# Altium schematic sheet BMS-Controller-Sheet.SchDoc: Title
size 420 x 297 mm; Date: *******; ApprovedBy: *******; CheckedBy: None; Author: *******; CompanyName: *******; DrawnBy: Name; Engineer: *******; Organization: *******; Address1: *******; Address2: *******; Address3: *******; Address4: *******; DocumentNumber: Doc Num; Revision: *******; SheetNumber: 4; SheetTotal: 4; CurrentTime: *******; CurrentDate: *******; Time: *******; DocumentFullPathAndName: *******; DocumentName: *******; ModifiedDate: *******; ImagePath: *******; ProjectName: *******; Application_BuildNumber: *******
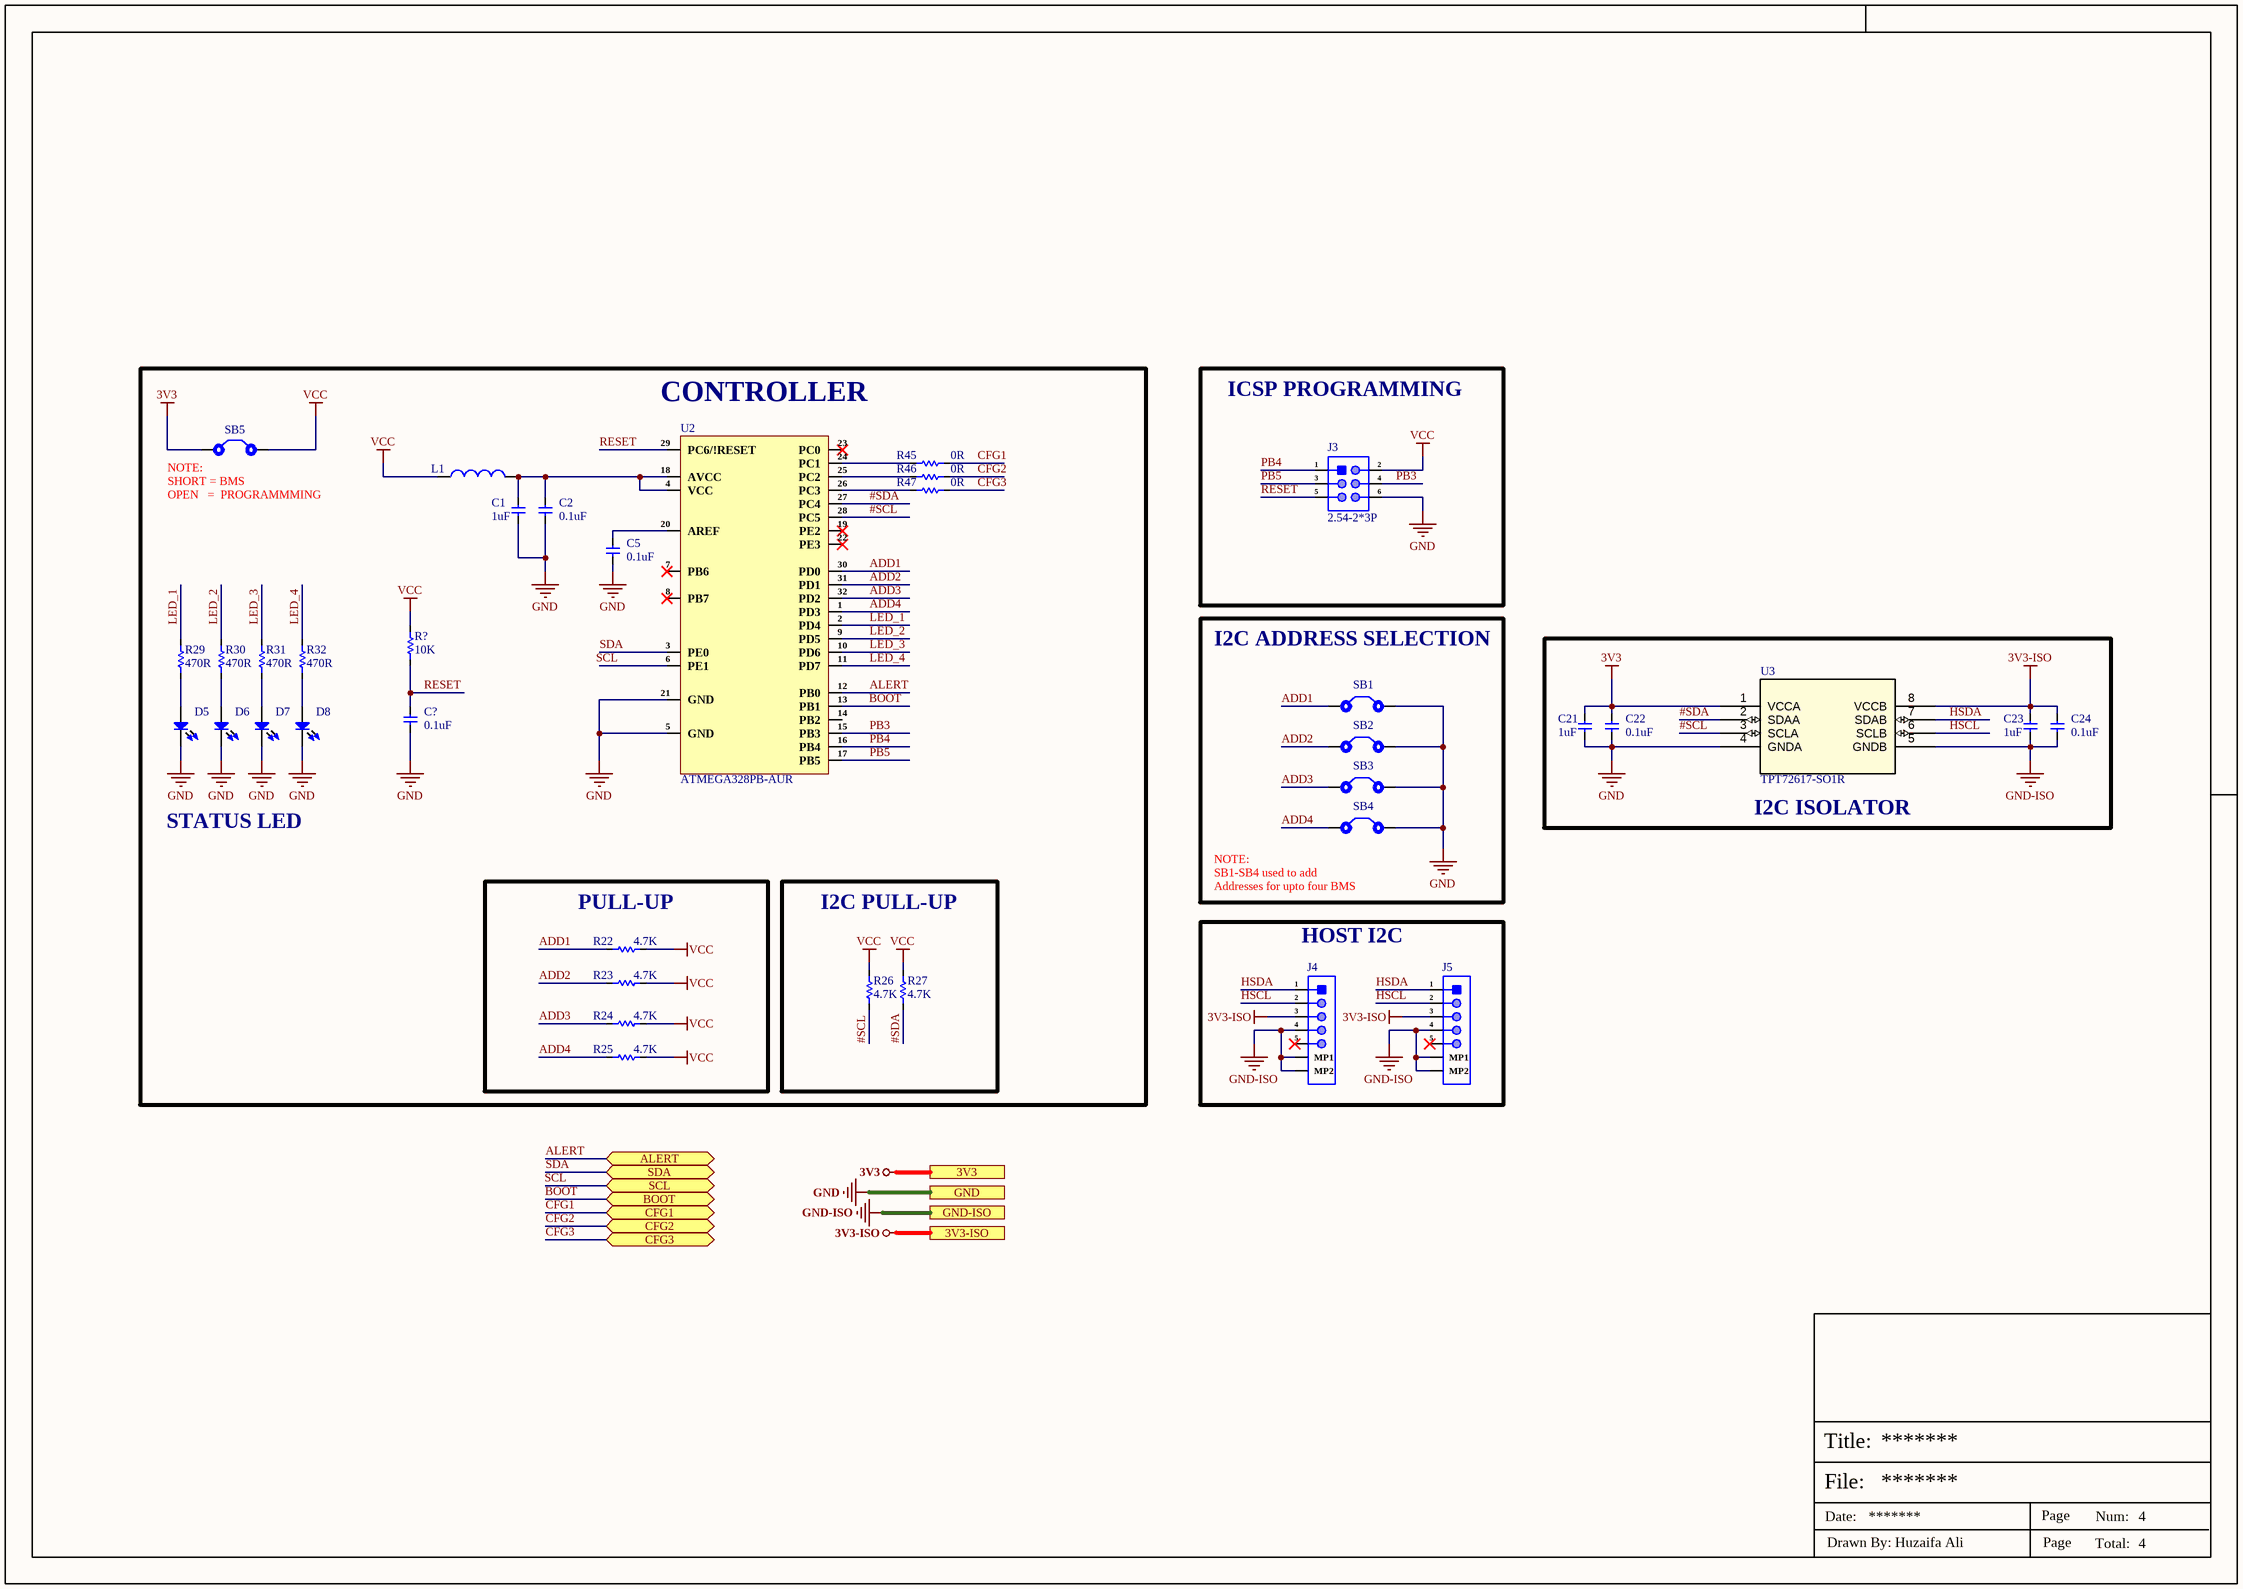
[diagram p0: BMS-Controller-Sheet.SchDoc]

## Parts
C1  1uF  [CAP-0201]
C2  0.1uF  [CAP-0201]
C5  0.1uF  [CAP-0201]
C21  1uF  [CAP-0201]
C22  0.1uF  [CAP-0201]
C23  1uF  [CAP-0201]
C24  0.1uF  [CAP-0201]
C?  0.1uF  [CAP-0201]
D5  QBLP617-IB  [LED-0603]  (value not drawn)
D6  QBLP617-IB  [LED-0603]  (value not drawn)
D7  QBLP617-IB  [LED-0603]  (value not drawn)
D8  QBLP617-IB  [LED-0603]  (value not drawn)
J3  2.54-2*3P  [2.54-2*3P]
J4  1.25-5PWB  [1.25-5PWB]  (value not drawn)
J5  1.25-5PWB  [1.25-5PWB]  (value not drawn)
L1  (no value)  [IND 0201]
R22  4.7K  [Res-0201]
R23  4.7K  [Res-0201]
R24  4.7K  [Res-0201]
R25  4.7K  [Res-0201]
R26  4.7K  [Res-0402]
R27  4.7K  [Res-0402]
R29  470R  [Res-0402]
R30  470R  [Res-0402]
R31  470R  [Res-0402]
R32  470R  [Res-0402]
R45  0R  [Res-0603]
R46  0R  [Res-0603]
R47  0R  [Res-0603]
R?  10K  [Res-0402]
SB1  Solder Bridge 0402  [Solder Bridge 0402]  (value not drawn)
SB2  Solder Bridge 0402  [Solder Bridge 0402]  (value not drawn)
SB3  Solder Bridge 0402  [Solder Bridge 0402]  (value not drawn)
SB4  Solder Bridge 0402  [Solder Bridge 0402]  (value not drawn)
SB5  Solder Bridge 0402  [Solder Bridge 0402]  (value not drawn)
U2  ATMEGA328PB-AUR  [32 TQFP (7x7)]
U3  TPT72617-SO1R  [SO1SOP-8-A_TPK]

## Blocks framed on the sheet
CONTROLLER: C1 C2 C5 C? D5-D8 L1 R29-R32 R45-R47 R? SB5 U2
ICSP PROGRAMMING: J3
I2C ADDRESS SELECTION: SB1-SB4
I2C ISOLATOR: C21-C24 U3
PULL-UP: R22-R25
I2C PULL-UP: R26 R27
HOST I2C: J4 J5

## Ports
3V3 (see Top-Sheet[3B], BATTERY_USB-Sheet[2C], BMS-Sheet[2D]), 3V3-ISO (see Top-Sheet[3C], BATTERY_USB-Sheet[2C]), ALERT (bidir, see Top-Sheet[3C], BMS-Sheet[1D]), BOOT (bidir, see Top-Sheet[3C], BMS-Sheet[1D]), CFG1 (bidir, see Top-Sheet[3C], BATTERY_USB-Sheet[1C]), CFG2 (bidir, see Top-Sheet[3C], BATTERY_USB-Sheet[1C]), CFG3 (bidir, see Top-Sheet[3C], BATTERY_USB-Sheet[1C]), GND (see Top-Sheet[3B], BATTERY_USB-Sheet[2C], BMS-Sheet[2D]), GND-ISO (see Top-Sheet[3C], BATTERY_USB-Sheet[2C]), SCL (bidir, see Top-Sheet[3C], BMS-Sheet[1D]), SDA (bidir, see Top-Sheet[3C], BMS-Sheet[1D])

## Nets
3V3: C21.1 C22.1 SB5.1 U3.1(VCCA) ; port 3V3
3V3-ISO: C23.1 C24.1 J4.3 J5.3 U3.8(VCCB) ; port 3V3-ISO
GND: C1.2 C2.2 C5.2 C21.2 C22.2 C?.2 D5.2 D6.2 D7.2 D8.2 J3.6 SB1.2 SB2.2 SB3.2 SB4.2 U2.5(GND) U2.21(GND) U3.4(GNDA) ; port GND
GND-ISO: C23.2 C24.2 J4.4 J4.MP1 J4.MP2 J5.4 J5.MP1 J5.MP2 U3.5(GNDB) ; port GND-ISO
VCC: J3.2 L1.1 R22.2 R23.2 R24.2 R25.2 R26.2 R27.2 R?.2 SB5.2
#SCL: R26.1 U2.28(PC5) U3.3(SCLA)
#SDA: R27.1 U2.27(PC4) U3.2(SDAA)
ADD1: R22.1 SB1.1 U2.30(PD0)
ADD2: R23.1 SB2.1 U2.31(PD1)
ADD3: R24.1 SB3.1 U2.32(PD2)
ADD4: R25.1 SB4.1 U2.1(PD3)
ALERT: U2.12(PB0) ; port ALERT
BOOT: U2.13(PB1) ; port BOOT
CFG1: R45.2 ; port CFG1
CFG2: R46.2 ; port CFG2
CFG3: R47.2 ; port CFG3
HSCL: J4.2 J5.2 U3.6(SCLB)
HSDA: J4.1 J5.1 U3.7(SDAB)
LED_1: R29.2 U2.2(PD4)
LED_2: R30.2 U2.9(PD5)
LED_3: R31.2 U2.10(PD6)
LED_4: R32.2 U2.11(PD7)
PB3: J3.4 U2.15(PB3)
PB4: J3.1 U2.16(PB4)
PB5: J3.3 U2.17(PB5)
RESET: C?.1 J3.5 R?.1 U2.29(PC6/!RESET)
SCL: U2.6(PE1) ; port SCL
SDA: U2.3(PE0) ; port SDA
NetC1_1: C1.1 C2.1 L1.2 U2.4(VCC) U2.18(AVCC)
NetC5_1: C5.1 U2.20(AREF)
NetD5_1: D5.1 R29.1
NetD6_1: D6.1 R30.1
NetD7_1: D7.1 R31.1
NetD8_1: D8.1 R32.1
NetR45_1: R45.1 U2.24(PC1)
NetR46_1: R46.1 U2.25(PC2)
NetR47_1: R47.1 U2.26(PC3)

Not connected (* = marked no-connect by the designer): J4 5*; J5 5*; U2 7(PB6)* 8(PB7)* 14(PB2) 19(PE2)* 22(PE3)* 23(PC0)*

## Notes on the sheet
- (near SB5) SHORT = BMS
  OPEN   =  PROGRAMMMING
- (near SB5) NOTE:
- STATUS LED
- NOTE:
- (near SB4) SB1-SB4 used to add Addresses for upto four BMS
- File:
- Title:
- Date:
- Page
- Num:
- Total:
- Drawn By: Huzaifa Ali

## Library data of the parts
C1 C21 C23 = CC0201MRX5R7BB105: CAP CER 1UF 16V X5R 0201; Manufacturer: Yageo; Item Type: Capacitor; Manufacturer Part Number: CC0201MRX5R7BB105; Supplier: Digi-Key; Supplier Part Number: 13-CC0201MRX5R7BB105TR-ND; RoHS: Yes; Category: Ceramic Capacitors; LCSC Part Number: C5182464
C2 C5 C22 C24 C? = GRM033C81E104KE14D: CAP CER 0.1UF 25V X6S 0201; Manufacturer: Murata; Capacitance: 100nF; Tolerance: 10%; Supplier 1: Digi-Key; Manufacturer Part Number: GRM033C81E104KE14D; Stock 1: 91; Pricing 1: 1=0.10000, 10=0.05100, 50=0.02780, 100=0.02260, 500=0.01616, 1000=0.01270, 2500=0.01155, 5000=0.01063 (USD); Mount: Surface Mount; Case/Package: 0201; Min Operating Temperature: -55°C; Max Operating Temperature: 105°C; Dielectric: X6S; Voltage Rating: 25V; Package Quantity: 15000; Packaging: Tape and Reel; Voltage Rating (DC): 25V; Length: 0.024inch; Height: 0.3mm; Width: 0.3mm; Thickness: 0.013inch; ComponentLink1URL: http://www.mouser.com/ds/2/281/c02e-2905.pdf?src-supplier=Mouser; ComponentLink1Description: http://www.mouser.com/ds/2/281/c02e-2905.pdf?src-supplier=Mouser; ComponentLink2URL: http://www.farnell.com/datasheets/2722733.pdf?src-supplier=Farnell; ComponentLink2Description: http://www.farnell.com/datasheets/2722733.pdf?src-supplier=Farnell; Supplier Part Number 1: 490-10403-1-ND; RoHS Compliant: Yes; RoHS: Yes; Category: Ceramic Capacitors; Case Code (Metric): 0603; Case Code (Imperial): 0201; Weight: 1.2E-05oz; Termination: SMD/SMT; ComponentLink3URL: http://search.murata.co.jp/Ceramy/image/img/A01X/G101/ENG/GRM033C81E104KE14-01.pdf?src-supplier=Digi-Key; ComponentLink3Description: http://search.murata.co.jp/Ceramy/image/img/A01X/G101/ENG/GRM033C81E104KE14-01.pdf?src-supplier=Digi-Key
D5-D8 = QBLP617-IB: LED BLUE CLEAR 0602 SMD R/A; Manufacturer: QT Brightek; Item Type: LEDs; Forward Current: 20mA; Forward Voltage: 3.1V; Luminous Intensity: 63mcd; Number of Circuits: 1; Power Dissipation: 111mW; Reverse Voltage: 5V; Shape: Rectangular; Viewing Angle: 140°; Wavelength: 470nm; Supplier: Arrow Electronics; Supplier Part Number: QBLP617-IB; Manufacturer Part Number: QBLP617-IB; RoHS: Compliant; Stock: 1867; Pricing: 1=0.0007 (USD); Case/Package: 0602; Color: Blue; Height: 600µm; Max Operating Temperature: 80°C; Min Operating Temperature: -40°C; Mounting Technology: Surface Mount; Number of Terminals: 2; REACH SVHC: Yes; Schedule B: 8541402000, 8541402000|8541402000|8541402000|8541402000|8541402000, 8541410000; Terminal Pitch: 2.1mm; ComponentLink1URL: https://datasheet.octopart.com:443/QBLP617-IB-QT-Brightek-datasheet-140961254.pdf?src-supplier=IHS; ComponentLink1Description: https://datasheet.octopart.com:443/QBLP617-IB-QT-Brightek-datasheet-140961254.pdf?src-supplier=IHS
J3 = 2.54-2*3P: Straight 6P 2.54mm 双排 Black Plugin,P=2.54mm Pin Headers ROHS; Manufacturer: BOOMELE(BOOM Precision Elec); Item Type: Male; Manufacturer Part Number: 2.54-2*3P; Package: SMD,P=2.54mm; LCSC Part Number: C65114; ComponentLink1Description: LCSC; ComponentLink1URL: https://www.lcsc.com/product-detail/Pin-Headers_BOOMELE-Boom-Precision-Elec-2-54-2-3P_C65114.html
J4 J5 = 1.25-5PWB: 1x5P 1 1.25mm Male pin 5 -25℃~+85℃ Surface Mount SMD,P=1.25mm Wire To Board / Wire To Wire Connector ROHS; Manufacturer: DEALON; Item Type: JST Right Angle; Manufacturer Part Number: 1.25-5PWB; Package: SMD,P=1.25mm; LCSC Part Number: C2905012; ComponentLink1Description: LCSC; ComponentLink1URL: https://www.lcsc.com/product-detail/Wire-To-Board-Wire-To-Wire-Connector_DEALON-1-25-5PWB_C2905012.html
L1 = MMZ0603S601CT000: FERRITE BEAD 600 OHM 0201 1LN; Manufacturer: TDK; Impedance: 600R; Tolerance: 25%; DC Resistance (DCR): 1.45R; Max DC Current: 100mA; Supplier 1: Digi-Key; Manufacturer Part Number: MMZ0603S601CT000; RoHS: Yes; Category: Inductors; Stock 1: 1540; Pricing 1: 1=0.12000, 10=0.09900, 25=0.07680, 50=0.06380, 100=0.05500, 250=0.04400, 500=0.03960, 1000=0.03300, 5000=0.03080 (USD); Mount: Surface Mount; Case/Package: 0201; Core Material: Ferrite; Case Code (Metric): 0603; Case Code (Imperial): 0201; Packaging: Cut Tape; Package Quantity: 15000; Current Rating: 100mA; Length: 0.024inch; Width: 0.012inch; Height: 0.013inch; REACH SVHC: No SVHC; Lead Free: Lead Free; RoHS Compliant: Yes; ComponentLink1URL: https://datasheet.ciiva.com/46381/1795294-46381669.pdf?src-supplier=Element14; ComponentLink1Description: https://datasheet.ciiva.com/46381/1795294-46381669.pdf?src-supplier=Element14; ComponentLink2URL: https://datasheet.ciiva.com/46634/beads-commercial-signal-mmz-en-46634390.pdf?src-supplier=Digi-Key; ComponentLink2Description: https://datasheet.ciiva.com/46634/beads-commercial-signal-mmz-en-46634390.pdf?src-supplier=Digi-Key; ComponentLink3URL: https://datasheet.ciiva.com/48682/beads-commercial-signal-mmz-en-48682603.pdf?src-supplier=Avnet; ComponentLink3Description: https://datasheet.ciiva.com/48682/beads-commercial-signal-mmz-en-48682603.pdf?src-supplier=Avnet; ComponentLink4URL: https://datasheet.ciiva.com/46634/beads-commercial-signal-mmz-en-46634381.pdf?src-supplier=Digi-Key; ComponentLink4Description: https://datasheet.ciiva.com/46634/beads-commercial-signal-mmz-en-46634381.pdf?src-supplier=Digi-Key; Supplier Part Number 1: 445-2146-1-ND
R22-R25 = RC0201FR-074K7L: RES 4.7K OHM 1% 1/20W 0201; Manufacturer: Yageo; Item Type: Resistor; Manufacturer Part Number: RC0201FR-074K7L; RoHS: Yes; Category: Chip SMD Resistors; ComponentLink1URL: https://datasheet.ciiva.com/2493/pyu-r-int-thick-7-2493811.pdf?src-supplier=Digi-Key; ComponentLink1Description: https://datasheet.ciiva.com/2493/pyu-r-int-thick-7-2493811.pdf?src-supplier=Digi-Key; ComponentLink2URL: https://datasheet.ciiva.com/2493/pyu-r-int-thick-7-2493812.pdf?src-supplier=Digi-Key; ComponentLink2Description: https://datasheet.ciiva.com/2493/pyu-r-int-thick-7-2493812.pdf?src-supplier=Digi-Key; ComponentLink3URL: https://datasheet.ciiva.com/2493/pyu-r-int-thick-7-2493813.pdf?src-supplier=Digi-Key; ComponentLink3Description: https://datasheet.ciiva.com/2493/pyu-r-int-thick-7-2493813.pdf?src-supplier=Digi-Key; ComponentLink4URL: https://datasheet.ciiva.com/8892/pyu-rc0201-51-rohs-l-8-8892942.pdf?src-supplier=Avnet; ComponentLink4Description: https://datasheet.ciiva.com/8892/pyu-rc0201-51-rohs-l-8-8892942.pdf?src-supplier=Avnet; ComponentLink5URL: https://datasheet.ciiva.com/7672/1563626-7672233.pdf?src-supplier=Element14; ComponentLink5Description: https://datasheet.ciiva.com/7672/1563626-7672233.pdf?src-supplier=Element14; LCSC Part Number: C138135; Supplier: Future Electronics; Supplier Part Number: 7537285; Stock: 1610000; Pricing: 10000=0.0014, 50000=0.0013, 250000=0.0013, 750000=0.0012, 2000000=0.0011 (USD)
R26 R27 = RC0402FR-074K7L: RES 4.7K OHM 1% 1/16W 0402; Manufacturer: Yageo; Resistance: 4.7kR; Temperature Coefficient: 100ppm/°C; Voltage Rating (DC): 50V; Power Rating: 62.5mW; Max Power Dissipation: 63mW; Item Type: Resistor; Supplier 1: Avnet; Manufacturer Part Number: RC0402FR-074K7L; RoHS: Yes; Category: Chip SMD Resistors; Stock 1: 2420000; Pricing 1: 10000=0.00085 (USD); Case/Package: 0402; Number of Pins: 2; Case Code (Imperial): 0402; Case Code (Metric): 1005; Min Operating Temperature: -55°C; Max Operating Temperature: 155°C; Tolerance: 1%; Resistor Type: Thick Film; Packaging: Tape and Reel; Voltage Rating: 50V; Termination: SMD/SMT; Features: Moisture Resistant; Series: RC; Number of Terminations: 2; Resistance Tolerance: 1%; Construction: Rectangular; Length: 1mm; Width: 0.5mm; Height: 0.32mm; Depth: 0.5mm; Lead Free: Lead Free; Military Standard: Not; RoHS Compliant: Yes; ComponentLink1URL: https://datasheet.ciiva.com/22661/1686128-22661342.pdf?src-supplier=Element14; ComponentLink1Description: https://datasheet.ciiva.com/22661/1686128-22661342.pdf?src-supplier=Element14; ComponentLink2URL: https://datasheet.ciiva.com/7850/1018594-7850022.pdf?src-supplier=Element14; ComponentLink2Description: https://datasheet.ciiva.com/7850/1018594-7850022.pdf?src-supplier=Element14; ComponentLink3URL: https://datasheet.ciiva.com/7850/1018594-7850023.pdf?src-supplier=Element14; ComponentLink3Description: https://datasheet.ciiva.com/7850/1018594-7850023.pdf?src-supplier=Element14; ComponentLink4URL: https://datasheet.ciiva.com/15215/getdatasheetpartid-328119-15215035.pdf?src-supplier=Verical; ComponentLink4Description: https://datasheet.ciiva.com/15215/getdatasheetpartid-328119-15215035.pdf?src-supplier=Verical; Supplier Part Number 1: RC0402FR-074K7L; LCSC Part Number: C105871; Size Code: 0402; Height - Seated (Max): 0.016inch; Reach SVHC Compliant: Yes
R29-R32 = RC0402FR-07470RL: RES 470 OHM 1% 1/16W 0402; Manufacturer: Yageo; Item Type: Resistor; Voltage Rating: 50V; Power Rating: 62.5mW; Temperature Coefficient: 100ppm/°C; Max Power Dissipation: 63mW; Supplier: Avnet; Supplier Part Number: RC0402FR-07470RL; Manufacturer Part Number: RC0402FR-07470RL; RoHS: Yes; Stock: 10000; Pricing: 10000=0.00085 (USD); Case/Package: 0402; Case Code (Metric): 1005; Case Code (Imperial): 0402; Min Operating Temperature: -55°C; Max Operating Temperature: 155°C; Packaging: Tape and Reel; Value: 470R; Tolerance: 1%; Number of Terminations: 2; Working Voltage: 50V; Package Quantity: 1; Resistor Type: Thick Film; Termination: SMD/SMT; Features: Moisture Resistant; Series: RC; Resistance Tolerance: 1%; Construction: Rectangular; Voltage Rating (AC): 50V; Length: 1mm; Width: 0.02inch; Height: 0.016inch; Depth: 0.5mm; Lead Free: Lead Free; Reach SVHC Compliant: No; RoHS Compliant: Yes; Military Standard: Not; ComponentLink1URL: https://datasheet.ciiva.com/46412/1018594-46412838.pdf?src-supplier=Element14; ComponentLink1Description: https://datasheet.ciiva.com/46412/1018594-46412838.pdf?src-supplier=Element14; ComponentLink2URL: https://datasheet.ciiva.com/2453/pyu-r-int-thick-7-2453377.pdf?src-supplier=Digikey; ComponentLink2Description: https://datasheet.ciiva.com/2453/pyu-r-int-thick-7-2453377.pdf?src-supplier=Digikey; ComponentLink3URL: https://datasheet.ciiva.com/2453/pyu-r-int-thick-7-2453378.pdf?src-supplier=Digikey; ComponentLink3Description: https://datasheet.ciiva.com/2453/pyu-r-int-thick-7-2453378.pdf?src-supplier=Digikey; ComponentLink4URL: https://datasheet.ciiva.com/2453/pyu-r-int-thick-7-2453376.pdf?src-supplier=Digikey; ComponentLink4Description: https://datasheet.ciiva.com/2453/pyu-r-int-thick-7-2453376.pdf?src-supplier=Digikey; ComponentLink5URL: https://datasheet.ciiva.com/7850/1018594-7850015.pdf?src-supplier=Element14; ComponentLink5Description: https://datasheet.ciiva.com/7850/1018594-7850015.pdf?src-supplier=Element14; ComponentLink6URL: https://datasheet.ciiva.com/7850/1018594-7850014.pdf?src-supplier=Element14; ComponentLink6Description: https://datasheet.ciiva.com/7850/1018594-7850014.pdf?src-supplier=Element14; ComponentLink7URL: https://datasheet.ciiva.com/15189/getdatasheetpartid-330246-15189463.pdf?src-supplier=Verical; ComponentLink7Description: https://datasheet.ciiva.com/15189/getdatasheetpartid-330246-15189463.pdf?src-supplier=Verical; LCSC Part Number: C114877
R45-R47 = RC0603JR-070RL: RES 0 OHM JUMPER 1/10W 0603; Manufacturer: Yageo; Resistance: 0mR; Tolerance: 1%; Power Rating: 100mW; Voltage Rating (DC): 50V; Temperature Coefficient: 200ppm/°C; Resistance Tolerance: 5%; Item Type: Resistor; Supplier 1: Digi-Key; Manufacturer Part Number: RC0603JR-070RL; RoHS: Yes; Category: Chip SMD Resistors; Stock 1: 18081776; Pricing 1: 1=0.10000, 10=0.01700, 25=0.01240, 50=0.00960, 100=0.00700, 250=0.00536, 500=0.00430, 1000=0.00316 (USD); Case/Package: 0603; Number of Pins: 2; Contact Plating: Tin,Matte; Case Code (Imperial): 0603; Case Code (Metric): 1608; Size Code: 0603; Min Operating Temperature: -55°C; Max Operating Temperature: 155°C; Resistor Type: Thick Film; Packaging: Tape and Reel; Termination: SMD/SMT; Series: RC; Technology: THICK FILM; Package Quantity: 5000; Voltage Rating: 50V; Features: Moisture Resistant; Max Power Dissipation: 100mW; Number of Terminations: 2; Construction: Rectangular; Length: 1.6mm; Width: 0.8mm; Height: 0.45mm; Depth: 0.8mm; Radiation Hardening: No; Reach SVHC Compliant: No SVHC; Lead Free: Lead Free; RoHS Compliant: Yes; Military Standard: Not; Supplier Part Number 1: 311-0.0GRCT-ND; LCSC Part Number: C95177
R? = SR0402FR-7T10KL: RES 10K OHM 1% 1/5W 0402; Manufacturer: Yageo; Supplier 1: Digi-Key; Manufacturer Part Number: SR0402FR-7T10KL; Stock 1: 7859; Pricing 1: 1=0.56, 10=0.398, 100=0.2072, 1000=0.11156, 2500=0.10757, 5000=0.10598 (USD); RoHS Compliant: Yes; ComponentLink1URL: http://www.yageo.com/documents/recent/PYu-SR_D_F%20tol_RoHS_L_3.pdf?src-supplier=Digi-Key; ComponentLink1Description: http://www.yageo.com/documents/recent/PYu-SR_D_F%20tol_RoHS_L_3.pdf?src-supplier=Digi-Key; Supplier Part Number 1: YAG5815CT-ND; LCSC Part Number: C854480
SB1-SB5 = Solder Bridge 0402: Solder Bridge ON; Manufacturer Part Number: Solder Bridge 0402; Item Type: Solder Bridge
U2 = ATMEGA328PB-AUR: IC MCU 8BIT 32KB FLASH 32TQFP; Manufacturer: Microchip; Number of A/D Converters: 1NUMBER; Number of ADC Channels: 8NUMBER; Number of I2C Channels: 2NUMBER; Number of PWM Channels: 10NUMBER; Supplier: Digikey; Supplier Part Number: ATMEGA328PB-AURCT-ND; Manufacturer Part Number: ATMEGA328PB-AUR; RoHS: No; Category: Microcontrollers; Stock: 17600; Pricing: 1=1.7, 25=1.56, 100=1.41 (USD); Number of SPI Channels: 2NUMBER; Number of UART Channels: 2NUMBER; Height: 1.2mm; ComponentLink1URL: http://www.atmel.com/images/atmel-42397-8-bit-avr-microcontroller-atmega328pb_summary.pdf?src-supplier=Avnet; ComponentLink1Description: http://www.atmel.com/images/atmel-42397-8-bit-avr-microcontroller-atmega328pb_summary.pdf?src-supplier=Avnet; ComponentLink2URL: http://www.microchip.com/mymicrochip/filehandler.aspx?ddocname=en589666&src-supplier=Digikey; ComponentLink2Description: http://www.microchip.com/mymicrochip/filehandler.aspx?ddocname=en589666&src-supplier=Digikey; ComponentLink3URL: https://datasheet.octopart.com/ATMEGA328PB-AUR-Microchip-datasheet-154741725.pdf?src-supplier=Electro+Sonic; ComponentLink3Description: https://datasheet.octopart.com/ATMEGA328PB-AUR-Microchip-datasheet-154741725.pdf?src-supplier=Electro+Sonic; ComponentLink4URL: https://datasheet.octopart.com/ATMEGA328PB-AUR-Microchip-datasheet-136376163.pdf?src-supplier=SHENGYU+ELECTRONICS; ComponentLink4Description: https://datasheet.octopart.com/ATMEGA328PB-AUR-Microchip-datasheet-136376163.pdf?src-supplier=SHENGYU+ELECTRONICS
U3 = TPT72617-SO1R: Description; Manufacturer_Name: 3Peak; Copyright: Copyright (C) 2025 Ultra Librarian. All rights reserved.; Manufacturer_Part_Number: TPT72617-SO1R; RefDes: RefDes; Type: Type